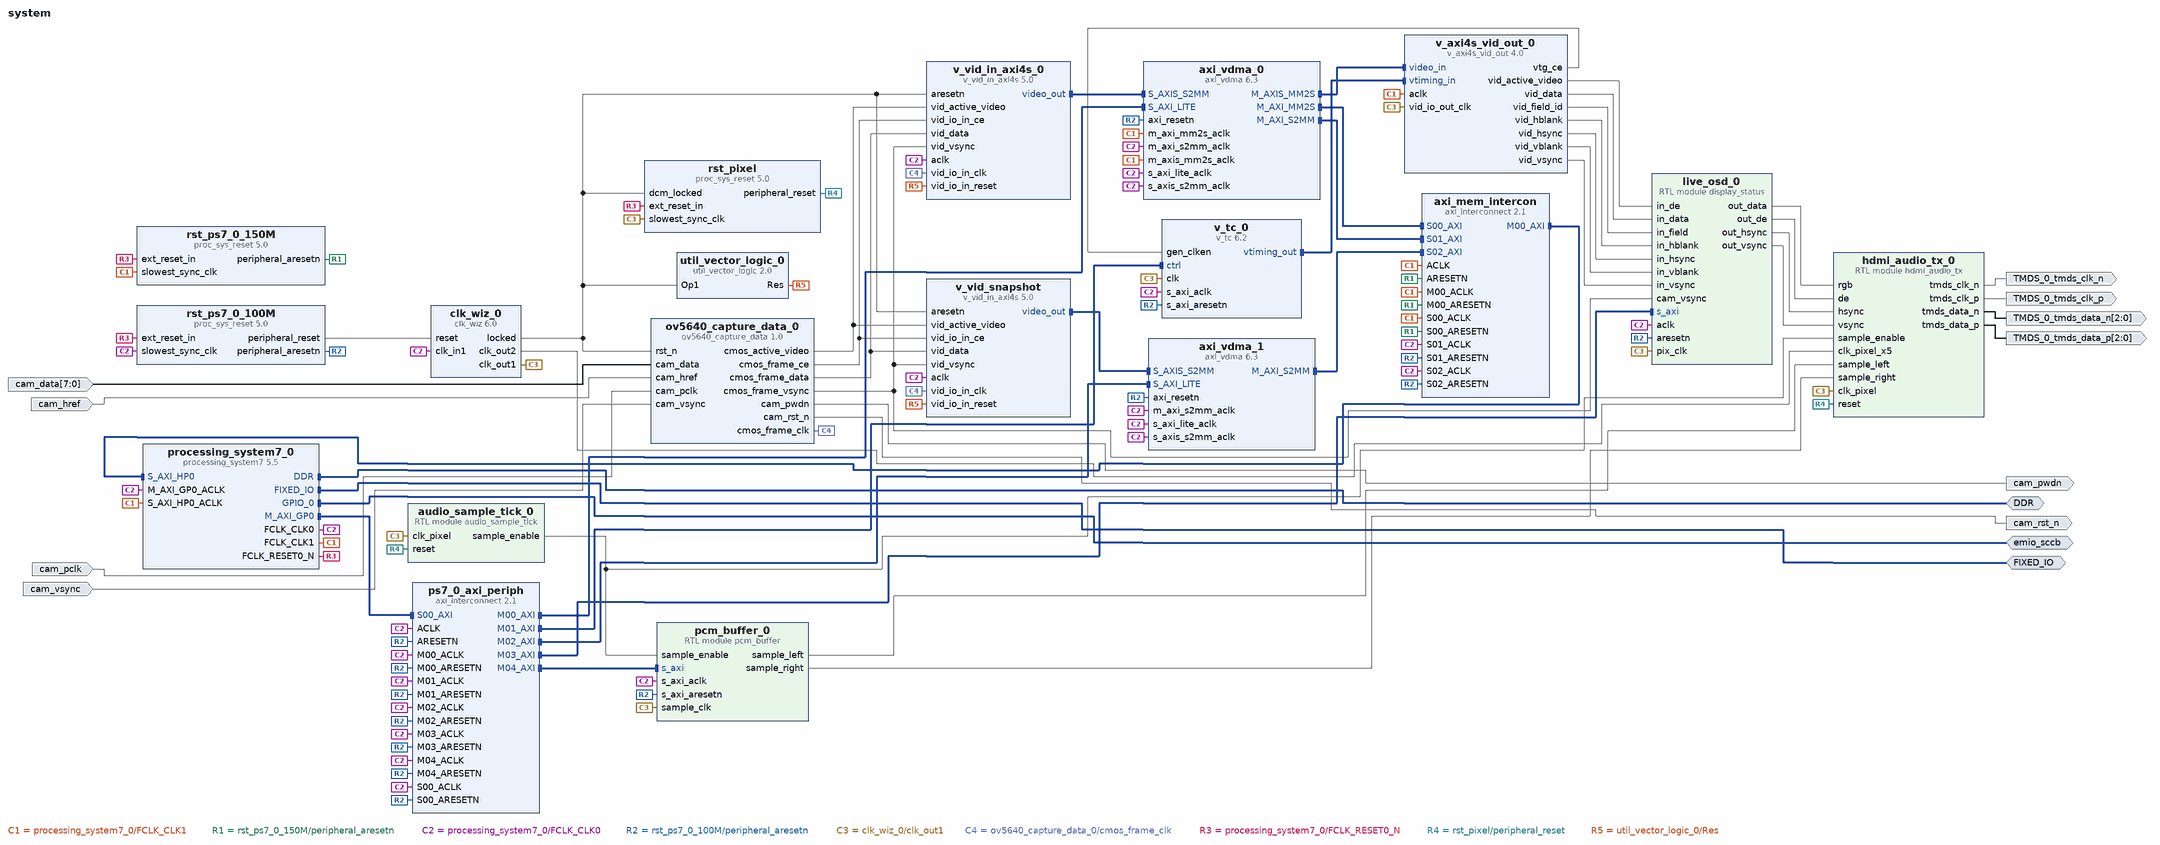
[diagram p0: block diagram of the top level]
# Vivado block design system, xc7z015clg485-2, Vivado 2025.2
create_bd_design system

create_bd_intf_port -mode Master -vlnv xilinx.com:interface:gpio_rtl:1.0 emio_sccb
create_bd_intf_port -mode Master -vlnv xilinx.com:interface:ddrx_rtl:1.0 DDR
create_bd_intf_port -mode Master -vlnv xilinx.com:display_processing_system7:fixedio_rtl:1.0 FIXED_IO
create_bd_port -dir O -from 2 -to 0 TMDS_0_tmds_data_p
create_bd_port -dir O TMDS_0_tmds_clk_p
create_bd_port -dir O -from 2 -to 0 TMDS_0_tmds_data_n
create_bd_port -dir O TMDS_0_tmds_clk_n
create_bd_port -dir I -type clk cam_pclk
set_property -dict {CONFIG.FREQ_HZ 100000000} [get_bd_ports cam_pclk]
create_bd_port -dir I cam_vsync
create_bd_port -dir I cam_href
create_bd_port -dir I -from 7 -to 0 cam_data
create_bd_port -dir O cam_rst_n
create_bd_port -dir O cam_pwdn

create_bd_cell -type ip -vlnv xilinx.com:ip:axi_interconnect:2.1 axi_mem_intercon
set_property -dict [list \
  CONFIG.ENABLE_ADVANCED_OPTIONS 0 \
  CONFIG.ENABLE_PROTOCOL_CHECKERS 0 \
  CONFIG.M00_HAS_DATA_FIFO 0 \
  CONFIG.M00_HAS_REGSLICE 0 \
  CONFIG.M00_ISSUANCE 0 \
  CONFIG.M00_SECURE 0 \
  CONFIG.M01_HAS_DATA_FIFO 0 \
  CONFIG.M01_HAS_REGSLICE 0 \
  CONFIG.M01_ISSUANCE 0 \
  CONFIG.M01_SECURE 0 \
  CONFIG.M02_HAS_DATA_FIFO 0 \
  CONFIG.M02_HAS_REGSLICE 0 \
  CONFIG.M02_ISSUANCE 0 \
  CONFIG.M02_SECURE 0 \
  CONFIG.M03_HAS_DATA_FIFO 0 \
  CONFIG.M03_HAS_REGSLICE 0 \
  CONFIG.M03_ISSUANCE 0 \
  CONFIG.M03_SECURE 0 \
  CONFIG.M04_HAS_DATA_FIFO 0 \
  CONFIG.M04_HAS_REGSLICE 0 \
  CONFIG.M04_ISSUANCE 0 \
  CONFIG.M04_SECURE 0 \
  CONFIG.M05_HAS_DATA_FIFO 0 \
  CONFIG.M05_HAS_REGSLICE 0 \
  CONFIG.M05_ISSUANCE 0 \
  CONFIG.M05_SECURE 0 \
  CONFIG.M06_HAS_DATA_FIFO 0 \
  CONFIG.M06_HAS_REGSLICE 0 \
  CONFIG.M06_ISSUANCE 0 \
  CONFIG.M06_SECURE 0 \
  CONFIG.M07_HAS_DATA_FIFO 0 \
  CONFIG.M07_HAS_REGSLICE 0 \
  CONFIG.M07_ISSUANCE 0 \
  CONFIG.M07_SECURE 0 \
  CONFIG.M08_HAS_DATA_FIFO 0 \
  CONFIG.M08_HAS_REGSLICE 0 \
  CONFIG.M08_ISSUANCE 0 \
  CONFIG.M08_SECURE 0 \
  CONFIG.M09_HAS_DATA_FIFO 0 \
  CONFIG.M09_HAS_REGSLICE 0 \
  CONFIG.M09_ISSUANCE 0 \
  CONFIG.M09_SECURE 0 \
  CONFIG.M10_HAS_DATA_FIFO 0 \
  CONFIG.M10_HAS_REGSLICE 0 \
  CONFIG.M10_ISSUANCE 0 \
  CONFIG.M10_SECURE 0 \
  CONFIG.M11_HAS_DATA_FIFO 0 \
  CONFIG.M11_HAS_REGSLICE 0 \
  CONFIG.M11_ISSUANCE 0 \
  CONFIG.M11_SECURE 0 \
  CONFIG.M12_HAS_DATA_FIFO 0 \
  CONFIG.M12_HAS_REGSLICE 0 \
  CONFIG.M12_ISSUANCE 0 \
  CONFIG.M12_SECURE 0 \
  CONFIG.M13_HAS_DATA_FIFO 0 \
  CONFIG.M13_HAS_REGSLICE 0 \
  CONFIG.M13_ISSUANCE 0 \
  CONFIG.M13_SECURE 0 \
  CONFIG.M14_HAS_DATA_FIFO 0 \
  CONFIG.M14_HAS_REGSLICE 0 \
  CONFIG.M14_ISSUANCE 0 \
  CONFIG.M14_SECURE 0 \
  CONFIG.M15_HAS_DATA_FIFO 0 \
  CONFIG.M15_HAS_REGSLICE 0 \
  CONFIG.M15_ISSUANCE 0 \
  CONFIG.M15_SECURE 0 \
  CONFIG.M16_HAS_DATA_FIFO 0 \
  CONFIG.M16_HAS_REGSLICE 0 \
  CONFIG.M16_ISSUANCE 0 \
  CONFIG.M16_SECURE 0 \
  CONFIG.M17_HAS_DATA_FIFO 0 \
  CONFIG.M17_HAS_REGSLICE 0 \
  CONFIG.M17_ISSUANCE 0 \
  CONFIG.M17_SECURE 0 \
  CONFIG.M18_HAS_DATA_FIFO 0 \
  CONFIG.M18_HAS_REGSLICE 0 \
  CONFIG.M18_ISSUANCE 0 \
  CONFIG.M18_SECURE 0 \
  CONFIG.M19_HAS_DATA_FIFO 0 \
  CONFIG.M19_HAS_REGSLICE 0 \
  CONFIG.M19_ISSUANCE 0 \
  CONFIG.M19_SECURE 0 \
  CONFIG.M20_HAS_DATA_FIFO 0 \
  CONFIG.M20_HAS_REGSLICE 0 \
  CONFIG.M20_ISSUANCE 0 \
  CONFIG.M20_SECURE 0 \
  CONFIG.M21_HAS_DATA_FIFO 0 \
  CONFIG.M21_HAS_REGSLICE 0 \
  CONFIG.M21_ISSUANCE 0 \
  CONFIG.M21_SECURE 0 \
  CONFIG.M22_HAS_DATA_FIFO 0 \
  CONFIG.M22_HAS_REGSLICE 0 \
  CONFIG.M22_ISSUANCE 0 \
  CONFIG.M22_SECURE 0 \
  CONFIG.M23_HAS_DATA_FIFO 0 \
  CONFIG.M23_HAS_REGSLICE 0 \
  CONFIG.M23_ISSUANCE 0 \
  CONFIG.M23_SECURE 0 \
  CONFIG.M24_HAS_DATA_FIFO 0 \
  CONFIG.M24_HAS_REGSLICE 0 \
  CONFIG.M24_ISSUANCE 0 \
  CONFIG.M24_SECURE 0 \
  CONFIG.M25_HAS_DATA_FIFO 0 \
  CONFIG.M25_HAS_REGSLICE 0 \
  CONFIG.M25_ISSUANCE 0 \
  CONFIG.M25_SECURE 0 \
  CONFIG.M26_HAS_DATA_FIFO 0 \
  CONFIG.M26_HAS_REGSLICE 0 \
  CONFIG.M26_ISSUANCE 0 \
  CONFIG.M26_SECURE 0 \
  CONFIG.M27_HAS_DATA_FIFO 0 \
  CONFIG.M27_HAS_REGSLICE 0 \
  CONFIG.M27_ISSUANCE 0 \
  CONFIG.M27_SECURE 0 \
  CONFIG.M28_HAS_DATA_FIFO 0 \
  CONFIG.M28_HAS_REGSLICE 0 \
  CONFIG.M28_ISSUANCE 0 \
  CONFIG.M28_SECURE 0 \
  CONFIG.M29_HAS_DATA_FIFO 0 \
  CONFIG.M29_HAS_REGSLICE 0 \
  CONFIG.M29_ISSUANCE 0 \
  CONFIG.M29_SECURE 0 \
  CONFIG.M30_HAS_DATA_FIFO 0 \
  CONFIG.M30_HAS_REGSLICE 0 \
  CONFIG.M30_ISSUANCE 0 \
  CONFIG.M30_SECURE 0 \
  CONFIG.M31_HAS_DATA_FIFO 0 \
  CONFIG.M31_HAS_REGSLICE 0 \
  CONFIG.M31_ISSUANCE 0 \
  CONFIG.M31_SECURE 0 \
  CONFIG.M32_HAS_DATA_FIFO 0 \
  CONFIG.M32_HAS_REGSLICE 0 \
  CONFIG.M32_ISSUANCE 0 \
  CONFIG.M32_SECURE 0 \
  CONFIG.M33_HAS_DATA_FIFO 0 \
  CONFIG.M33_HAS_REGSLICE 0 \
  CONFIG.M33_ISSUANCE 0 \
  CONFIG.M33_SECURE 0 \
  CONFIG.M34_HAS_DATA_FIFO 0 \
  CONFIG.M34_HAS_REGSLICE 0 \
  CONFIG.M34_ISSUANCE 0 \
  CONFIG.M34_SECURE 0 \
  CONFIG.M35_HAS_DATA_FIFO 0 \
  CONFIG.M35_HAS_REGSLICE 0 \
  CONFIG.M35_ISSUANCE 0 \
  CONFIG.M35_SECURE 0 \
  CONFIG.M36_HAS_DATA_FIFO 0 \
  CONFIG.M36_HAS_REGSLICE 0 \
  CONFIG.M36_ISSUANCE 0 \
  CONFIG.M36_SECURE 0 \
  CONFIG.M37_HAS_DATA_FIFO 0 \
  CONFIG.M37_HAS_REGSLICE 0 \
  CONFIG.M37_ISSUANCE 0 \
  CONFIG.M37_SECURE 0 \
  CONFIG.M38_HAS_DATA_FIFO 0 \
  CONFIG.M38_HAS_REGSLICE 0 \
  CONFIG.M38_ISSUANCE 0 \
  CONFIG.M38_SECURE 0 \
  CONFIG.M39_HAS_DATA_FIFO 0 \
  CONFIG.M39_HAS_REGSLICE 0 \
  CONFIG.M39_ISSUANCE 0 \
  CONFIG.M39_SECURE 0 \
  CONFIG.M40_HAS_DATA_FIFO 0 \
  CONFIG.M40_HAS_REGSLICE 0 \
  CONFIG.M40_ISSUANCE 0 \
  CONFIG.M40_SECURE 0 \
  CONFIG.M41_HAS_DATA_FIFO 0 \
  CONFIG.M41_HAS_REGSLICE 0 \
  CONFIG.M41_ISSUANCE 0 \
  CONFIG.M41_SECURE 0 \
  CONFIG.M42_HAS_DATA_FIFO 0 \
  CONFIG.M42_HAS_REGSLICE 0 \
  CONFIG.M42_ISSUANCE 0 \
  CONFIG.M42_SECURE 0 \
  CONFIG.M43_HAS_DATA_FIFO 0 \
  CONFIG.M43_HAS_REGSLICE 0 \
  CONFIG.M43_ISSUANCE 0 \
  CONFIG.M43_SECURE 0 \
  CONFIG.M44_HAS_DATA_FIFO 0 \
  CONFIG.M44_HAS_REGSLICE 0 \
  CONFIG.M44_ISSUANCE 0 \
  CONFIG.M44_SECURE 0 \
  CONFIG.M45_HAS_DATA_FIFO 0 \
  CONFIG.M45_HAS_REGSLICE 0 \
  CONFIG.M45_ISSUANCE 0 \
  CONFIG.M45_SECURE 0 \
  CONFIG.M46_HAS_DATA_FIFO 0 \
  CONFIG.M46_HAS_REGSLICE 0 \
  CONFIG.M46_ISSUANCE 0 \
  CONFIG.M46_SECURE 0 \
  CONFIG.M47_HAS_DATA_FIFO 0 \
  CONFIG.M47_HAS_REGSLICE 0 \
  CONFIG.M47_ISSUANCE 0 \
  CONFIG.M47_SECURE 0 \
  CONFIG.M48_HAS_DATA_FIFO 0 \
  CONFIG.M48_HAS_REGSLICE 0 \
  CONFIG.M48_ISSUANCE 0 \
  CONFIG.M48_SECURE 0 \
  CONFIG.M49_HAS_DATA_FIFO 0 \
  CONFIG.M49_HAS_REGSLICE 0 \
  CONFIG.M49_ISSUANCE 0 \
  CONFIG.M49_SECURE 0 \
  CONFIG.M50_HAS_DATA_FIFO 0 \
  CONFIG.M50_HAS_REGSLICE 0 \
  CONFIG.M50_ISSUANCE 0 \
  CONFIG.M50_SECURE 0 \
  CONFIG.M51_HAS_DATA_FIFO 0 \
  CONFIG.M51_HAS_REGSLICE 0 \
  CONFIG.M51_ISSUANCE 0 \
  CONFIG.M51_SECURE 0 \
  CONFIG.M52_HAS_DATA_FIFO 0 \
  CONFIG.M52_HAS_REGSLICE 0 \
  CONFIG.M52_ISSUANCE 0 \
  CONFIG.M52_SECURE 0 \
  CONFIG.M53_HAS_DATA_FIFO 0 \
  CONFIG.M53_HAS_REGSLICE 0 \
  CONFIG.M53_ISSUANCE 0 \
  CONFIG.M53_SECURE 0 \
  CONFIG.M54_HAS_DATA_FIFO 0 \
  CONFIG.M54_HAS_REGSLICE 0 \
  CONFIG.M54_ISSUANCE 0 \
  CONFIG.M54_SECURE 0 \
  CONFIG.M55_HAS_DATA_FIFO 0 \
  CONFIG.M55_HAS_REGSLICE 0 \
  CONFIG.M55_ISSUANCE 0 \
  CONFIG.M55_SECURE 0 \
  CONFIG.M56_HAS_DATA_FIFO 0 \
  CONFIG.M56_HAS_REGSLICE 0 \
  CONFIG.M56_ISSUANCE 0 \
  CONFIG.M56_SECURE 0 \
  CONFIG.M57_HAS_DATA_FIFO 0 \
  CONFIG.M57_HAS_REGSLICE 0 \
  CONFIG.M57_ISSUANCE 0 \
  CONFIG.M57_SECURE 0 \
  CONFIG.M58_HAS_DATA_FIFO 0 \
  CONFIG.M58_HAS_REGSLICE 0 \
  CONFIG.M58_ISSUANCE 0 \
  CONFIG.M58_SECURE 0 \
  CONFIG.M59_HAS_DATA_FIFO 0 \
  CONFIG.M59_HAS_REGSLICE 0 \
  CONFIG.M59_ISSUANCE 0 \
  CONFIG.M59_SECURE 0 \
  CONFIG.M60_HAS_DATA_FIFO 0 \
  CONFIG.M60_HAS_REGSLICE 0 \
  CONFIG.M60_ISSUANCE 0 \
  CONFIG.M60_SECURE 0 \
  CONFIG.M61_HAS_DATA_FIFO 0 \
  CONFIG.M61_HAS_REGSLICE 0 \
  CONFIG.M61_ISSUANCE 0 \
  CONFIG.M61_SECURE 0 \
  CONFIG.M62_HAS_DATA_FIFO 0 \
  CONFIG.M62_HAS_REGSLICE 0 \
  CONFIG.M62_ISSUANCE 0 \
  CONFIG.M62_SECURE 0 \
  CONFIG.M63_HAS_DATA_FIFO 0 \
  CONFIG.M63_HAS_REGSLICE 0 \
  CONFIG.M63_ISSUANCE 0 \
  CONFIG.M63_SECURE 0 \
  CONFIG.NUM_MI 1 \
  CONFIG.NUM_SI 3 \
  CONFIG.PCHK_MAX_RD_BURSTS 2 \
  CONFIG.PCHK_MAX_WR_BURSTS 2 \
  CONFIG.PCHK_WAITS 0 \
  CONFIG.S00_ARB_PRIORITY 0 \
  CONFIG.S00_HAS_DATA_FIFO 0 \
  CONFIG.S00_HAS_REGSLICE 0 \
  CONFIG.S01_ARB_PRIORITY 0 \
  CONFIG.S01_HAS_DATA_FIFO 0 \
  CONFIG.S01_HAS_REGSLICE 0 \
  CONFIG.S02_ARB_PRIORITY 0 \
  CONFIG.S02_HAS_DATA_FIFO 0 \
  CONFIG.S02_HAS_REGSLICE 0 \
  CONFIG.S03_ARB_PRIORITY 0 \
  CONFIG.S03_HAS_DATA_FIFO 0 \
  CONFIG.S03_HAS_REGSLICE 0 \
  CONFIG.S04_ARB_PRIORITY 0 \
  CONFIG.S04_HAS_DATA_FIFO 0 \
  CONFIG.S04_HAS_REGSLICE 0 \
  CONFIG.S05_ARB_PRIORITY 0 \
  CONFIG.S05_HAS_DATA_FIFO 0 \
  CONFIG.S05_HAS_REGSLICE 0 \
  CONFIG.S06_ARB_PRIORITY 0 \
  CONFIG.S06_HAS_DATA_FIFO 0 \
  CONFIG.S06_HAS_REGSLICE 0 \
  CONFIG.S07_ARB_PRIORITY 0 \
  CONFIG.S07_HAS_DATA_FIFO 0 \
  CONFIG.S07_HAS_REGSLICE 0 \
  CONFIG.S08_ARB_PRIORITY 0 \
  CONFIG.S08_HAS_DATA_FIFO 0 \
  CONFIG.S08_HAS_REGSLICE 0 \
  CONFIG.S09_ARB_PRIORITY 0 \
  CONFIG.S09_HAS_DATA_FIFO 0 \
  CONFIG.S09_HAS_REGSLICE 0 \
  CONFIG.S10_ARB_PRIORITY 0 \
  CONFIG.S10_HAS_DATA_FIFO 0 \
  CONFIG.S10_HAS_REGSLICE 0 \
  CONFIG.S11_ARB_PRIORITY 0 \
  CONFIG.S11_HAS_DATA_FIFO 0 \
  CONFIG.S11_HAS_REGSLICE 0 \
  CONFIG.S12_ARB_PRIORITY 0 \
  CONFIG.S12_HAS_DATA_FIFO 0 \
  CONFIG.S12_HAS_REGSLICE 0 \
  CONFIG.S13_ARB_PRIORITY 0 \
  CONFIG.S13_HAS_DATA_FIFO 0 \
  CONFIG.S13_HAS_REGSLICE 0 \
  CONFIG.S14_ARB_PRIORITY 0 \
  CONFIG.S14_HAS_DATA_FIFO 0 \
  CONFIG.S14_HAS_REGSLICE 0 \
  CONFIG.S15_ARB_PRIORITY 0 \
  CONFIG.S15_HAS_DATA_FIFO 0 \
  CONFIG.S15_HAS_REGSLICE 0 \
  CONFIG.STRATEGY 0 \
  CONFIG.SYNCHRONIZATION_STAGES 3 \
  CONFIG.XBAR_DATA_WIDTH 32 \
] [get_bd_cells axi_mem_intercon]
create_bd_cell -type ip -vlnv xilinx.com:ip:axi_vdma:6.3 axi_vdma_0
set_property -dict [list \
  CONFIG.C_FAMILY zynq \
  CONFIG.C_SELECT_XPM 0 \
  CONFIG.c_addr_width 32 \
  CONFIG.c_dlytmr_resolution 125 \
  CONFIG.c_dynamic_resolution 1 \
  CONFIG.c_enable_all 0 \
  CONFIG.c_enable_mm2s_buf_empty 0 \
  CONFIG.c_enable_mm2s_delay_counter 1 \
  CONFIG.c_enable_mm2s_frm_counter 1 \
  CONFIG.c_enable_mm2s_frmstr_reg 0 \
  CONFIG.c_enable_mm2s_fsync_out 0 \
  CONFIG.c_enable_mm2s_param_updt 0 \
  CONFIG.c_enable_mm2s_rst_out 0 \
  CONFIG.c_enable_s2mm_buf_full 0 \
  CONFIG.c_enable_s2mm_delay_counter 1 \
  CONFIG.c_enable_s2mm_frm_counter 1 \
  CONFIG.c_enable_s2mm_frmstr_reg 0 \
  CONFIG.c_enable_s2mm_fsync_out 0 \
  CONFIG.c_enable_s2mm_param_updt 0 \
  CONFIG.c_enable_s2mm_rst_out 0 \
  CONFIG.c_enable_s2mm_sts_reg 0 \
  CONFIG.c_enable_tstvec 0 \
  CONFIG.c_enable_vert_flip 0 \
  CONFIG.c_enable_vidprmtr_reads 1 \
  CONFIG.c_flush_on_fsync 1 \
  CONFIG.c_include_internal_genlock 1 \
  CONFIG.c_include_mm2s 1 \
  CONFIG.c_include_mm2s_dre 0 \
  CONFIG.c_include_mm2s_sf 0 \
  CONFIG.c_include_s2mm 1 \
  CONFIG.c_include_s2mm_dre 0 \
  CONFIG.c_include_s2mm_sf 1 \
  CONFIG.c_include_sg 0 \
  CONFIG.c_m_axi_mm2s_data_width 64 \
  CONFIG.c_m_axi_s2mm_data_width 64 \
  CONFIG.c_m_axis_mm2s_tdata_width 24 \
  CONFIG.c_mm2s_genlock_mode 3 \
  CONFIG.c_mm2s_genlock_num_masters 1 \
  CONFIG.c_mm2s_genlock_repeat_en 0 \
  CONFIG.c_mm2s_linebuffer_depth 2048 \
  CONFIG.c_mm2s_linebuffer_thresh 4 \
  CONFIG.c_mm2s_max_burst_length 64 \
  CONFIG.c_mm2s_sof_enable 1 \
  CONFIG.c_num_fstores 3 \
  CONFIG.c_s2mm_genlock_mode 2 \
  CONFIG.c_s2mm_genlock_num_masters 1 \
  CONFIG.c_s2mm_genlock_repeat_en 1 \
  CONFIG.c_s2mm_linebuffer_depth 2048 \
  CONFIG.c_s2mm_linebuffer_thresh 4 \
  CONFIG.c_s2mm_max_burst_length 64 \
  CONFIG.c_s2mm_sof_enable 1 \
  CONFIG.c_use_fsync 1 \
  CONFIG.c_use_mm2s_fsync 0 \
  CONFIG.c_use_s2mm_fsync 2 \
] [get_bd_cells axi_vdma_0]
create_bd_cell -type ip -vlnv xilinx.com:ip:axi_vdma:6.3 axi_vdma_1
set_property -dict [list \
  CONFIG.C_FAMILY zynq \
  CONFIG.C_SELECT_XPM 0 \
  CONFIG.c_addr_width 32 \
  CONFIG.c_dlytmr_resolution 125 \
  CONFIG.c_dynamic_resolution 1 \
  CONFIG.c_enable_all 0 \
  CONFIG.c_enable_mm2s_buf_empty 0 \
  CONFIG.c_enable_mm2s_delay_counter 1 \
  CONFIG.c_enable_mm2s_frm_counter 1 \
  CONFIG.c_enable_mm2s_frmstr_reg 0 \
  CONFIG.c_enable_mm2s_fsync_out 0 \
  CONFIG.c_enable_mm2s_param_updt 0 \
  CONFIG.c_enable_mm2s_rst_out 0 \
  CONFIG.c_enable_s2mm_buf_full 0 \
  CONFIG.c_enable_s2mm_delay_counter 1 \
  CONFIG.c_enable_s2mm_frm_counter 1 \
  CONFIG.c_enable_s2mm_frmstr_reg 0 \
  CONFIG.c_enable_s2mm_fsync_out 0 \
  CONFIG.c_enable_s2mm_param_updt 0 \
  CONFIG.c_enable_s2mm_rst_out 0 \
  CONFIG.c_enable_s2mm_sts_reg 0 \
  CONFIG.c_enable_tstvec 0 \
  CONFIG.c_enable_vert_flip 0 \
  CONFIG.c_enable_vidprmtr_reads 1 \
  CONFIG.c_flush_on_fsync 1 \
  CONFIG.c_include_internal_genlock 0 \
  CONFIG.c_include_mm2s 0 \
  CONFIG.c_include_mm2s_sf 0 \
  CONFIG.c_include_s2mm 1 \
  CONFIG.c_include_s2mm_dre 0 \
  CONFIG.c_include_s2mm_sf 1 \
  CONFIG.c_include_sg 0 \
  CONFIG.c_m_axi_s2mm_data_width 64 \
  CONFIG.c_mm2s_genlock_repeat_en 0 \
  CONFIG.c_mm2s_linebuffer_thresh 4 \
  CONFIG.c_mm2s_sof_enable 1 \
  CONFIG.c_num_fstores 2 \
  CONFIG.c_s2mm_genlock_mode 0 \
  CONFIG.c_s2mm_genlock_repeat_en 1 \
  CONFIG.c_s2mm_linebuffer_depth 2048 \
  CONFIG.c_s2mm_linebuffer_thresh 4 \
  CONFIG.c_s2mm_max_burst_length 64 \
  CONFIG.c_s2mm_sof_enable 1 \
  CONFIG.c_use_fsync 1 \
  CONFIG.c_use_s2mm_fsync 2 \
] [get_bd_cells axi_vdma_1]
create_bd_cell -type ip -vlnv xilinx.com:ip:clk_wiz:6.0 clk_wiz_0
set_property -dict [list \
  CONFIG.AUTO_PRIMITIVE MMCM \
  CONFIG.AXI_DRP false \
  CONFIG.CALC_DONE empty \
  CONFIG.CDDCDONE_PORT cddcdone \
  CONFIG.CDDCREQ_PORT cddcreq \
  CONFIG.CLKFB_IN_N_PORT clkfb_in_n \
  CONFIG.CLKFB_IN_PORT clkfb_in \
  CONFIG.CLKFB_IN_P_PORT clkfb_in_p \
  CONFIG.CLKFB_IN_SIGNALING SINGLE \
  CONFIG.CLKFB_OUT_N_PORT clkfb_out_n \
  CONFIG.CLKFB_OUT_PORT clkfb_out \
  CONFIG.CLKFB_OUT_P_PORT clkfb_out_p \
  CONFIG.CLKFB_STOPPED_PORT clkfb_stopped \
  CONFIG.CLKIN1_JITTER_PS 100.0 \
  CONFIG.CLKIN1_UI_JITTER 0.010 \
  CONFIG.CLKIN2_JITTER_PS 100.0 \
  CONFIG.CLKIN2_UI_JITTER 0.010 \
  CONFIG.CLKOUT1_DRIVES BUFG \
  CONFIG.CLKOUT1_JITTER 152.549 \
  CONFIG.CLKOUT1_MATCHED_ROUTING false \
  CONFIG.CLKOUT1_PHASE_ERROR 116.405 \
  CONFIG.CLKOUT1_REQUESTED_DUTY_CYCLE 50.000 \
  CONFIG.CLKOUT1_REQUESTED_OUT_FREQ 75.000 \
  CONFIG.CLKOUT1_REQUESTED_PHASE 0.000 \
  CONFIG.CLKOUT1_SEQUENCE_NUMBER 1 \
  CONFIG.CLKOUT1_USED true \
  CONFIG.CLKOUT2_DRIVES BUFG \
  CONFIG.CLKOUT2_JITTER 111.604 \
  CONFIG.CLKOUT2_MATCHED_ROUTING false \
  CONFIG.CLKOUT2_PHASE_ERROR 116.405 \
  CONFIG.CLKOUT2_REQUESTED_DUTY_CYCLE 50.000 \
  CONFIG.CLKOUT2_REQUESTED_OUT_FREQ 375.000 \
  CONFIG.CLKOUT2_REQUESTED_PHASE 0.000 \
  CONFIG.CLKOUT2_SEQUENCE_NUMBER 1 \
  CONFIG.CLKOUT2_USED true \
  CONFIG.CLKOUT3_DRIVES BUFG \
  CONFIG.CLKOUT3_JITTER 132.464 \
  CONFIG.CLKOUT3_MATCHED_ROUTING false \
  CONFIG.CLKOUT3_PHASE_ERROR 116.405 \
  CONFIG.CLKOUT3_REQUESTED_DUTY_CYCLE 50.000 \
  CONFIG.CLKOUT3_REQUESTED_OUT_FREQ 150.000 \
  CONFIG.CLKOUT3_REQUESTED_PHASE 0.000 \
  CONFIG.CLKOUT3_SEQUENCE_NUMBER 1 \
  CONFIG.CLKOUT3_USED true \
  CONFIG.CLKOUT4_DRIVES BUFG \
  CONFIG.CLKOUT4_JITTER 0.0 \
  CONFIG.CLKOUT4_MATCHED_ROUTING false \
  CONFIG.CLKOUT4_PHASE_ERROR 0.0 \
  CONFIG.CLKOUT4_REQUESTED_DUTY_CYCLE 50.000 \
  CONFIG.CLKOUT4_REQUESTED_OUT_FREQ 100.000 \
  CONFIG.CLKOUT4_REQUESTED_PHASE 0.000 \
  CONFIG.CLKOUT4_SEQUENCE_NUMBER 1 \
  CONFIG.CLKOUT4_USED false \
  CONFIG.CLKOUT5_DRIVES BUFG \
  CONFIG.CLKOUT5_JITTER 0.0 \
  CONFIG.CLKOUT5_MATCHED_ROUTING false \
  CONFIG.CLKOUT5_PHASE_ERROR 0.0 \
  CONFIG.CLKOUT5_REQUESTED_DUTY_CYCLE 50.000 \
  CONFIG.CLKOUT5_REQUESTED_OUT_FREQ 100.000 \
  CONFIG.CLKOUT5_REQUESTED_PHASE 0.000 \
  CONFIG.CLKOUT5_SEQUENCE_NUMBER 1 \
  CONFIG.CLKOUT5_USED false \
  CONFIG.CLKOUT6_DRIVES BUFG \
  CONFIG.CLKOUT6_JITTER 0.0 \
  CONFIG.CLKOUT6_MATCHED_ROUTING false \
  CONFIG.CLKOUT6_PHASE_ERROR 0.0 \
  CONFIG.CLKOUT6_REQUESTED_DUTY_CYCLE 50.000 \
  CONFIG.CLKOUT6_REQUESTED_OUT_FREQ 100.000 \
  CONFIG.CLKOUT6_REQUESTED_PHASE 0.000 \
  CONFIG.CLKOUT6_SEQUENCE_NUMBER 1 \
  CONFIG.CLKOUT6_USED false \
  CONFIG.CLKOUT7_DRIVES BUFG \
  CONFIG.CLKOUT7_JITTER 0.0 \
  CONFIG.CLKOUT7_MATCHED_ROUTING false \
  CONFIG.CLKOUT7_PHASE_ERROR 0.0 \
  CONFIG.CLKOUT7_REQUESTED_DUTY_CYCLE 50.000 \
  CONFIG.CLKOUT7_REQUESTED_OUT_FREQ 100.000 \
  CONFIG.CLKOUT7_REQUESTED_PHASE 0.000 \
  CONFIG.CLKOUT7_SEQUENCE_NUMBER 1 \
  CONFIG.CLKOUT7_USED false \
  CONFIG.CLKOUTPHY_REQUESTED_FREQ 600.000 \
  CONFIG.CLK_IN1_BOARD_INTERFACE Custom \
  CONFIG.CLK_IN2_BOARD_INTERFACE Custom \
  CONFIG.CLK_IN_SEL_PORT clk_in_sel \
  CONFIG.CLK_OUT1_PORT clk_out1 \
  CONFIG.CLK_OUT1_USE_FINE_PS_GUI false \
  CONFIG.CLK_OUT2_PORT clk_out2 \
  CONFIG.CLK_OUT2_USE_FINE_PS_GUI false \
  CONFIG.CLK_OUT3_PORT clk_out3 \
  CONFIG.CLK_OUT3_USE_FINE_PS_GUI false \
  CONFIG.CLK_OUT4_PORT clk_out4 \
  CONFIG.CLK_OUT4_USE_FINE_PS_GUI false \
  CONFIG.CLK_OUT5_PORT clk_out5 \
  CONFIG.CLK_OUT5_USE_FINE_PS_GUI false \
  CONFIG.CLK_OUT6_PORT clk_out6 \
  CONFIG.CLK_OUT6_USE_FINE_PS_GUI false \
  CONFIG.CLK_OUT7_PORT clk_out7 \
  CONFIG.CLK_OUT7_USE_FINE_PS_GUI false \
  CONFIG.CLK_VALID_PORT CLK_VALID \
  CONFIG.CLOCK_MGR_TYPE auto \
  CONFIG.DADDR_PORT daddr \
  CONFIG.DCLK_PORT dclk \
  CONFIG.DEN_PORT den \
  CONFIG.DIFF_CLK_IN1_BOARD_INTERFACE Custom \
  CONFIG.DIFF_CLK_IN2_BOARD_INTERFACE Custom \
  CONFIG.DIN_PORT din \
  CONFIG.DOUT_PORT dout \
  CONFIG.DRDY_PORT drdy \
  CONFIG.DWE_PORT dwe \
  CONFIG.ENABLE_CDDC false \
  CONFIG.ENABLE_CLKOUTPHY false \
  CONFIG.ENABLE_CLOCK_MONITOR false \
  CONFIG.ENABLE_USER_CLOCK0 false \
  CONFIG.ENABLE_USER_CLOCK1 false \
  CONFIG.ENABLE_USER_CLOCK2 false \
  CONFIG.ENABLE_USER_CLOCK3 false \
  CONFIG.Enable_PLL0 false \
  CONFIG.Enable_PLL1 false \
  CONFIG.FEEDBACK_SOURCE FDBK_AUTO \
  CONFIG.INPUT_CLK_STOPPED_PORT input_clk_stopped \
  CONFIG.INPUT_MODE frequency \
  CONFIG.INTERFACE_SELECTION Enable_AXI \
  CONFIG.IN_FREQ_UNITS Units_MHz \
  CONFIG.IN_JITTER_UNITS Units_UI \
  CONFIG.JITTER_OPTIONS UI \
  CONFIG.JITTER_SEL No_Jitter \
  CONFIG.LOCKED_PORT locked \
  CONFIG.MMCM_BANDWIDTH OPTIMIZED \
  CONFIG.MMCM_CLKFBOUT_MULT_F 7.500 \
  CONFIG.MMCM_CLKFBOUT_PHASE 0.000 \
  CONFIG.MMCM_CLKFBOUT_USE_FINE_PS false \
  CONFIG.MMCM_CLKIN1_PERIOD 10.000 \
  CONFIG.MMCM_CLKIN2_PERIOD 10.000 \
  CONFIG.MMCM_CLKOUT0_DIVIDE_F 10.000 \
  CONFIG.MMCM_CLKOUT0_DUTY_CYCLE 0.500 \
  CONFIG.MMCM_CLKOUT0_PHASE 0.000 \
  CONFIG.MMCM_CLKOUT0_USE_FINE_PS false \
  CONFIG.MMCM_CLKOUT1_DIVIDE 2 \
  CONFIG.MMCM_CLKOUT1_DUTY_CYCLE 0.500 \
  CONFIG.MMCM_CLKOUT1_PHASE 0.000 \
  CONFIG.MMCM_CLKOUT1_USE_FINE_PS false \
  CONFIG.MMCM_CLKOUT2_DIVIDE 5 \
  CONFIG.MMCM_CLKOUT2_DUTY_CYCLE 0.500 \
  CONFIG.MMCM_CLKOUT2_PHASE 0.000 \
  CONFIG.MMCM_CLKOUT2_USE_FINE_PS false \
  CONFIG.MMCM_CLKOUT3_DIVIDE 1 \
  CONFIG.MMCM_CLKOUT3_DUTY_CYCLE 0.500 \
  CONFIG.MMCM_CLKOUT3_PHASE 0.000 \
  CONFIG.MMCM_CLKOUT3_USE_FINE_PS false \
  CONFIG.MMCM_CLKOUT4_CASCADE false \
  CONFIG.MMCM_CLKOUT4_DIVIDE 1 \
  CONFIG.MMCM_CLKOUT4_DUTY_CYCLE 0.500 \
  CONFIG.MMCM_CLKOUT4_PHASE 0.000 \
  CONFIG.MMCM_CLKOUT4_USE_FINE_PS false \
  CONFIG.MMCM_CLKOUT5_DIVIDE 1 \
  CONFIG.MMCM_CLKOUT5_DUTY_CYCLE 0.500 \
  CONFIG.MMCM_CLKOUT5_PHASE 0.000 \
  CONFIG.MMCM_CLKOUT5_USE_FINE_PS false \
  CONFIG.MMCM_CLKOUT6_DIVIDE 1 \
  CONFIG.MMCM_CLKOUT6_DUTY_CYCLE 0.500 \
  CONFIG.MMCM_CLKOUT6_PHASE 0.000 \
  CONFIG.MMCM_CLKOUT6_USE_FINE_PS false \
  CONFIG.MMCM_CLOCK_HOLD false \
  CONFIG.MMCM_COMPENSATION ZHOLD \
  CONFIG.MMCM_DIVCLK_DIVIDE 1 \
  CONFIG.MMCM_NOTES None \
  CONFIG.MMCM_REF_JITTER1 0.010 \
  CONFIG.MMCM_REF_JITTER2 0.010 \
  CONFIG.MMCM_STARTUP_WAIT false \
  CONFIG.NUM_OUT_CLKS 3 \
  CONFIG.OPTIMIZE_CLOCKING_STRUCTURE_EN false \
  CONFIG.OVERRIDE_MMCM false \
  CONFIG.OVERRIDE_PLL false \
  CONFIG.PHASESHIFT_MODE WAVEFORM \
  CONFIG.PHASE_DUTY_CONFIG false \
  CONFIG.PLATFORM UNKNOWN \
  CONFIG.PLL_BANDWIDTH OPTIMIZED \
  CONFIG.PLL_CLKFBOUT_MULT 4 \
  CONFIG.PLL_CLKFBOUT_PHASE 0.000 \
  CONFIG.PLL_CLKIN_PERIOD 10.000 \
  CONFIG.PLL_CLKOUT0_DIVIDE 1 \
  CONFIG.PLL_CLKOUT0_DUTY_CYCLE 0.500 \
  CONFIG.PLL_CLKOUT0_PHASE 0.000 \
  CONFIG.PLL_CLKOUT1_DIVIDE 1 \
  CONFIG.PLL_CLKOUT1_DUTY_CYCLE 0.500 \
  CONFIG.PLL_CLKOUT1_PHASE 0.000 \
  CONFIG.PLL_CLKOUT2_DIVIDE 1 \
  CONFIG.PLL_CLKOUT2_DUTY_CYCLE 0.500 \
  CONFIG.PLL_CLKOUT2_PHASE 0.000 \
  CONFIG.PLL_CLKOUT3_DIVIDE 1 \
  CONFIG.PLL_CLKOUT3_DUTY_CYCLE 0.500 \
  CONFIG.PLL_CLKOUT3_PHASE 0.000 \
  CONFIG.PLL_CLKOUT4_DIVIDE 1 \
  CONFIG.PLL_CLKOUT4_DUTY_CYCLE 0.500 \
  CONFIG.PLL_CLKOUT4_PHASE 0.000 \
  CONFIG.PLL_CLKOUT5_DIVIDE 1 \
  CONFIG.PLL_CLKOUT5_DUTY_CYCLE 0.500 \
  CONFIG.PLL_CLKOUT5_PHASE 0.000 \
  CONFIG.PLL_CLK_FEEDBACK CLKFBOUT \
  CONFIG.PLL_COMPENSATION SYSTEM_SYNCHRONOUS \
  CONFIG.PLL_DIVCLK_DIVIDE 1 \
  CONFIG.PLL_NOTES None \
  CONFIG.PLL_REF_JITTER 0.010 \
  CONFIG.POWER_DOWN_PORT power_down \
  CONFIG.PRECISION 1 \
  CONFIG.PRIMARY_PORT clk_in1 \
  CONFIG.PRIMITIVE MMCM \
  CONFIG.PRIMTYPE_SEL mmcm_adv \
  CONFIG.PRIM_IN_FREQ 100.000 \
  CONFIG.PRIM_IN_JITTER 0.010 \
  CONFIG.PRIM_IN_TIMEPERIOD 10.000 \
  CONFIG.PRIM_SOURCE No_buffer \
  CONFIG.PSCLK_PORT psclk \
  CONFIG.PSDONE_PORT psdone \
  CONFIG.PSEN_PORT psen \
  CONFIG.PSINCDEC_PORT psincdec \
  CONFIG.REF_CLK_FREQ 100.0 \
  CONFIG.RELATIVE_INCLK REL_PRIMARY \
  CONFIG.RESET_BOARD_INTERFACE Custom \
  CONFIG.RESET_PORT reset \
  CONFIG.RESET_TYPE ACTIVE_HIGH \
  CONFIG.SECONDARY_IN_FREQ 100.000 \
  CONFIG.SECONDARY_IN_JITTER 0.010 \
  CONFIG.SECONDARY_IN_TIMEPERIOD 10.000 \
  CONFIG.SECONDARY_PORT clk_in2 \
  CONFIG.SECONDARY_SOURCE Single_ended_clock_capable_pin \
  CONFIG.SS_MODE CENTER_HIGH \
  CONFIG.SS_MOD_FREQ 250 \
  CONFIG.SS_MOD_TIME 0.004 \
  CONFIG.STATUS_PORT STATUS \
  CONFIG.SUMMARY_STRINGS empty \
  CONFIG.USER_CLK_FREQ0 100.0 \
  CONFIG.USER_CLK_FREQ1 100.0 \
  CONFIG.USER_CLK_FREQ2 100.0 \
  CONFIG.USER_CLK_FREQ3 100.0 \
  CONFIG.USE_BOARD_FLOW false \
  CONFIG.USE_CLKFB_STOPPED false \
  CONFIG.USE_CLK_VALID false \
  CONFIG.USE_CLOCK_SEQUENCING false \
  CONFIG.USE_DYN_PHASE_SHIFT false \
  CONFIG.USE_DYN_RECONFIG false \
  CONFIG.USE_FREEZE false \
  CONFIG.USE_FREQ_SYNTH true \
  CONFIG.USE_INCLK_STOPPED false \
  CONFIG.USE_INCLK_SWITCHOVER false \
  CONFIG.USE_LOCKED true \
  CONFIG.USE_MAX_I_JITTER false \
  CONFIG.USE_MIN_O_JITTER false \
  CONFIG.USE_MIN_POWER false \
  CONFIG.USE_PHASE_ALIGNMENT true \
  CONFIG.USE_POWER_DOWN false \
  CONFIG.USE_RESET true \
  CONFIG.USE_SAFE_CLOCK_STARTUP false \
  CONFIG.USE_SPREAD_SPECTRUM false \
  CONFIG.USE_STATUS false \
] [get_bd_cells clk_wiz_0]
create_bd_cell -type module -reference display_status live_osd_0
set_property -dict {CONFIG.HEIGHT 720 CONFIG.PIXEL_HZ 75000000 CONFIG.WIDTH 1280} [get_bd_cells live_osd_0]
create_bd_cell -type ip -vlnv alientek.com:user:ov5640_capture_data:1.0 ov5640_capture_data_0
create_bd_cell -type ip -vlnv xilinx.com:ip:processing_system7:5.5 processing_system7_0
set_property -dict [list \
  CONFIG.PCW_APU_PERIPHERAL_FREQMHZ 666.666666 \
  CONFIG.PCW_CPU_CPU_6X4X_MAX_RANGE 767 \
  CONFIG.PCW_ENET0_ENET0_IO {MIO 16 .. 27} \
  CONFIG.PCW_ENET0_GRP_MDIO_ENABLE 1 \
  CONFIG.PCW_ENET0_GRP_MDIO_IO {MIO 52 .. 53} \
  CONFIG.PCW_ENET0_PERIPHERAL_ENABLE 1 \
  CONFIG.PCW_EN_CLK1_PORT 1 \
  CONFIG.PCW_FCLK_CLK0_BUF FALSE \
  CONFIG.PCW_FCLK_CLK1_BUF TRUE \
  CONFIG.PCW_FPGA0_PERIPHERAL_FREQMHZ 100 \
  CONFIG.PCW_FPGA1_PERIPHERAL_FREQMHZ 150 \
  CONFIG.PCW_FPGA_FCLK1_ENABLE 1 \
  CONFIG.PCW_GPIO_EMIO_GPIO_ENABLE 1 \
  CONFIG.PCW_GPIO_EMIO_GPIO_IO 2 \
  CONFIG.PCW_GPIO_EMIO_GPIO_WIDTH 2 \
  CONFIG.PCW_GPIO_MIO_GPIO_ENABLE 0 \
  CONFIG.PCW_PERIPHERAL_BOARD_PRESET None \
  CONFIG.PCW_PRESET_BANK1_VOLTAGE {LVCMOS 1.8V} \
  CONFIG.PCW_QSPI_PERIPHERAL_ENABLE 0 \
  CONFIG.PCW_SD0_GRP_CD_ENABLE 1 \
  CONFIG.PCW_SD0_GRP_CD_IO {MIO 10} \
  CONFIG.PCW_SD0_GRP_WP_ENABLE 0 \
  CONFIG.PCW_SD0_PERIPHERAL_ENABLE 1 \
  CONFIG.PCW_SD0_SD0_IO {MIO 40 .. 45} \
  CONFIG.PCW_SDIO_PERIPHERAL_FREQMHZ 100 \
  CONFIG.PCW_UART0_PERIPHERAL_ENABLE 1 \
  CONFIG.PCW_UART0_UART0_IO {MIO 14 .. 15} \
  CONFIG.PCW_UART1_PERIPHERAL_ENABLE 0 \
  CONFIG.PCW_UART_PERIPHERAL_FREQMHZ 100 \
  CONFIG.PCW_UIPARAM_DDR_FREQ_MHZ 533.333333 \
  CONFIG.PCW_UIPARAM_DDR_MEMORY_TYPE {DDR 3 (Low Voltage)} \
  CONFIG.PCW_UIPARAM_DDR_PARTNO {MT41K256M16 RE-125} \
  CONFIG.PCW_USB0_PERIPHERAL_ENABLE 0 \
  CONFIG.PCW_USE_S_AXI_HP0 1 \
  CONFIG.preset None \
] [get_bd_cells processing_system7_0]
# 403 more settings of processing_system7_0 are not shown: defaults, MIO pin electricals, DDR timing, and values the tool derives
create_bd_cell -type ip -vlnv xilinx.com:ip:axi_interconnect:2.1 ps7_0_axi_periph
set_property -dict [list \
  CONFIG.ENABLE_ADVANCED_OPTIONS 0 \
  CONFIG.ENABLE_PROTOCOL_CHECKERS 0 \
  CONFIG.M00_HAS_DATA_FIFO 0 \
  CONFIG.M00_HAS_REGSLICE 0 \
  CONFIG.M00_ISSUANCE 0 \
  CONFIG.M00_SECURE 0 \
  CONFIG.M01_HAS_DATA_FIFO 0 \
  CONFIG.M01_HAS_REGSLICE 0 \
  CONFIG.M01_ISSUANCE 0 \
  CONFIG.M01_SECURE 0 \
  CONFIG.M02_HAS_DATA_FIFO 0 \
  CONFIG.M02_HAS_REGSLICE 0 \
  CONFIG.M02_ISSUANCE 0 \
  CONFIG.M02_SECURE 0 \
  CONFIG.M03_HAS_DATA_FIFO 0 \
  CONFIG.M03_HAS_REGSLICE 0 \
  CONFIG.M03_ISSUANCE 0 \
  CONFIG.M03_SECURE 0 \
  CONFIG.M04_HAS_DATA_FIFO 0 \
  CONFIG.M04_HAS_REGSLICE 0 \
  CONFIG.M04_ISSUANCE 0 \
  CONFIG.M04_SECURE 0 \
  CONFIG.M05_HAS_DATA_FIFO 0 \
  CONFIG.M05_HAS_REGSLICE 0 \
  CONFIG.M05_ISSUANCE 0 \
  CONFIG.M05_SECURE 0 \
  CONFIG.M06_HAS_DATA_FIFO 0 \
  CONFIG.M06_HAS_REGSLICE 0 \
  CONFIG.M06_ISSUANCE 0 \
  CONFIG.M06_SECURE 0 \
  CONFIG.M07_HAS_DATA_FIFO 0 \
  CONFIG.M07_HAS_REGSLICE 0 \
  CONFIG.M07_ISSUANCE 0 \
  CONFIG.M07_SECURE 0 \
  CONFIG.M08_HAS_DATA_FIFO 0 \
  CONFIG.M08_HAS_REGSLICE 0 \
  CONFIG.M08_ISSUANCE 0 \
  CONFIG.M08_SECURE 0 \
  CONFIG.M09_HAS_DATA_FIFO 0 \
  CONFIG.M09_HAS_REGSLICE 0 \
  CONFIG.M09_ISSUANCE 0 \
  CONFIG.M09_SECURE 0 \
  CONFIG.M10_HAS_DATA_FIFO 0 \
  CONFIG.M10_HAS_REGSLICE 0 \
  CONFIG.M10_ISSUANCE 0 \
  CONFIG.M10_SECURE 0 \
  CONFIG.M11_HAS_DATA_FIFO 0 \
  CONFIG.M11_HAS_REGSLICE 0 \
  CONFIG.M11_ISSUANCE 0 \
  CONFIG.M11_SECURE 0 \
  CONFIG.M12_HAS_DATA_FIFO 0 \
  CONFIG.M12_HAS_REGSLICE 0 \
  CONFIG.M12_ISSUANCE 0 \
  CONFIG.M12_SECURE 0 \
  CONFIG.M13_HAS_DATA_FIFO 0 \
  CONFIG.M13_HAS_REGSLICE 0 \
  CONFIG.M13_ISSUANCE 0 \
  CONFIG.M13_SECURE 0 \
  CONFIG.M14_HAS_DATA_FIFO 0 \
  CONFIG.M14_HAS_REGSLICE 0 \
  CONFIG.M14_ISSUANCE 0 \
  CONFIG.M14_SECURE 0 \
  CONFIG.M15_HAS_DATA_FIFO 0 \
  CONFIG.M15_HAS_REGSLICE 0 \
  CONFIG.M15_ISSUANCE 0 \
  CONFIG.M15_SECURE 0 \
  CONFIG.M16_HAS_DATA_FIFO 0 \
  CONFIG.M16_HAS_REGSLICE 0 \
  CONFIG.M16_ISSUANCE 0 \
  CONFIG.M16_SECURE 0 \
  CONFIG.M17_HAS_DATA_FIFO 0 \
  CONFIG.M17_HAS_REGSLICE 0 \
  CONFIG.M17_ISSUANCE 0 \
  CONFIG.M17_SECURE 0 \
  CONFIG.M18_HAS_DATA_FIFO 0 \
  CONFIG.M18_HAS_REGSLICE 0 \
  CONFIG.M18_ISSUANCE 0 \
  CONFIG.M18_SECURE 0 \
  CONFIG.M19_HAS_DATA_FIFO 0 \
  CONFIG.M19_HAS_REGSLICE 0 \
  CONFIG.M19_ISSUANCE 0 \
  CONFIG.M19_SECURE 0 \
  CONFIG.M20_HAS_DATA_FIFO 0 \
  CONFIG.M20_HAS_REGSLICE 0 \
  CONFIG.M20_ISSUANCE 0 \
  CONFIG.M20_SECURE 0 \
  CONFIG.M21_HAS_DATA_FIFO 0 \
  CONFIG.M21_HAS_REGSLICE 0 \
  CONFIG.M21_ISSUANCE 0 \
  CONFIG.M21_SECURE 0 \
  CONFIG.M22_HAS_DATA_FIFO 0 \
  CONFIG.M22_HAS_REGSLICE 0 \
  CONFIG.M22_ISSUANCE 0 \
  CONFIG.M22_SECURE 0 \
  CONFIG.M23_HAS_DATA_FIFO 0 \
  CONFIG.M23_HAS_REGSLICE 0 \
  CONFIG.M23_ISSUANCE 0 \
  CONFIG.M23_SECURE 0 \
  CONFIG.M24_HAS_DATA_FIFO 0 \
  CONFIG.M24_HAS_REGSLICE 0 \
  CONFIG.M24_ISSUANCE 0 \
  CONFIG.M24_SECURE 0 \
  CONFIG.M25_HAS_DATA_FIFO 0 \
  CONFIG.M25_HAS_REGSLICE 0 \
  CONFIG.M25_ISSUANCE 0 \
  CONFIG.M25_SECURE 0 \
  CONFIG.M26_HAS_DATA_FIFO 0 \
  CONFIG.M26_HAS_REGSLICE 0 \
  CONFIG.M26_ISSUANCE 0 \
  CONFIG.M26_SECURE 0 \
  CONFIG.M27_HAS_DATA_FIFO 0 \
  CONFIG.M27_HAS_REGSLICE 0 \
  CONFIG.M27_ISSUANCE 0 \
  CONFIG.M27_SECURE 0 \
  CONFIG.M28_HAS_DATA_FIFO 0 \
  CONFIG.M28_HAS_REGSLICE 0 \
  CONFIG.M28_ISSUANCE 0 \
  CONFIG.M28_SECURE 0 \
  CONFIG.M29_HAS_DATA_FIFO 0 \
  CONFIG.M29_HAS_REGSLICE 0 \
  CONFIG.M29_ISSUANCE 0 \
  CONFIG.M29_SECURE 0 \
  CONFIG.M30_HAS_DATA_FIFO 0 \
  CONFIG.M30_HAS_REGSLICE 0 \
  CONFIG.M30_ISSUANCE 0 \
  CONFIG.M30_SECURE 0 \
  CONFIG.M31_HAS_DATA_FIFO 0 \
  CONFIG.M31_HAS_REGSLICE 0 \
  CONFIG.M31_ISSUANCE 0 \
  CONFIG.M31_SECURE 0 \
  CONFIG.M32_HAS_DATA_FIFO 0 \
  CONFIG.M32_HAS_REGSLICE 0 \
  CONFIG.M32_ISSUANCE 0 \
  CONFIG.M32_SECURE 0 \
  CONFIG.M33_HAS_DATA_FIFO 0 \
  CONFIG.M33_HAS_REGSLICE 0 \
  CONFIG.M33_ISSUANCE 0 \
  CONFIG.M33_SECURE 0 \
  CONFIG.M34_HAS_DATA_FIFO 0 \
  CONFIG.M34_HAS_REGSLICE 0 \
  CONFIG.M34_ISSUANCE 0 \
  CONFIG.M34_SECURE 0 \
  CONFIG.M35_HAS_DATA_FIFO 0 \
  CONFIG.M35_HAS_REGSLICE 0 \
  CONFIG.M35_ISSUANCE 0 \
  CONFIG.M35_SECURE 0 \
  CONFIG.M36_HAS_DATA_FIFO 0 \
  CONFIG.M36_HAS_REGSLICE 0 \
  CONFIG.M36_ISSUANCE 0 \
  CONFIG.M36_SECURE 0 \
  CONFIG.M37_HAS_DATA_FIFO 0 \
  CONFIG.M37_HAS_REGSLICE 0 \
  CONFIG.M37_ISSUANCE 0 \
  CONFIG.M37_SECURE 0 \
  CONFIG.M38_HAS_DATA_FIFO 0 \
  CONFIG.M38_HAS_REGSLICE 0 \
  CONFIG.M38_ISSUANCE 0 \
  CONFIG.M38_SECURE 0 \
  CONFIG.M39_HAS_DATA_FIFO 0 \
  CONFIG.M39_HAS_REGSLICE 0 \
  CONFIG.M39_ISSUANCE 0 \
  CONFIG.M39_SECURE 0 \
  CONFIG.M40_HAS_DATA_FIFO 0 \
  CONFIG.M40_HAS_REGSLICE 0 \
  CONFIG.M40_ISSUANCE 0 \
  CONFIG.M40_SECURE 0 \
  CONFIG.M41_HAS_DATA_FIFO 0 \
  CONFIG.M41_HAS_REGSLICE 0 \
  CONFIG.M41_ISSUANCE 0 \
  CONFIG.M41_SECURE 0 \
  CONFIG.M42_HAS_DATA_FIFO 0 \
  CONFIG.M42_HAS_REGSLICE 0 \
  CONFIG.M42_ISSUANCE 0 \
  CONFIG.M42_SECURE 0 \
  CONFIG.M43_HAS_DATA_FIFO 0 \
  CONFIG.M43_HAS_REGSLICE 0 \
  CONFIG.M43_ISSUANCE 0 \
  CONFIG.M43_SECURE 0 \
  CONFIG.M44_HAS_DATA_FIFO 0 \
  CONFIG.M44_HAS_REGSLICE 0 \
  CONFIG.M44_ISSUANCE 0 \
  CONFIG.M44_SECURE 0 \
  CONFIG.M45_HAS_DATA_FIFO 0 \
  CONFIG.M45_HAS_REGSLICE 0 \
  CONFIG.M45_ISSUANCE 0 \
  CONFIG.M45_SECURE 0 \
  CONFIG.M46_HAS_DATA_FIFO 0 \
  CONFIG.M46_HAS_REGSLICE 0 \
  CONFIG.M46_ISSUANCE 0 \
  CONFIG.M46_SECURE 0 \
  CONFIG.M47_HAS_DATA_FIFO 0 \
  CONFIG.M47_HAS_REGSLICE 0 \
  CONFIG.M47_ISSUANCE 0 \
  CONFIG.M47_SECURE 0 \
  CONFIG.M48_HAS_DATA_FIFO 0 \
  CONFIG.M48_HAS_REGSLICE 0 \
  CONFIG.M48_ISSUANCE 0 \
  CONFIG.M48_SECURE 0 \
  CONFIG.M49_HAS_DATA_FIFO 0 \
  CONFIG.M49_HAS_REGSLICE 0 \
  CONFIG.M49_ISSUANCE 0 \
  CONFIG.M49_SECURE 0 \
  CONFIG.M50_HAS_DATA_FIFO 0 \
  CONFIG.M50_HAS_REGSLICE 0 \
  CONFIG.M50_ISSUANCE 0 \
  CONFIG.M50_SECURE 0 \
  CONFIG.M51_HAS_DATA_FIFO 0 \
  CONFIG.M51_HAS_REGSLICE 0 \
  CONFIG.M51_ISSUANCE 0 \
  CONFIG.M51_SECURE 0 \
  CONFIG.M52_HAS_DATA_FIFO 0 \
  CONFIG.M52_HAS_REGSLICE 0 \
  CONFIG.M52_ISSUANCE 0 \
  CONFIG.M52_SECURE 0 \
  CONFIG.M53_HAS_DATA_FIFO 0 \
  CONFIG.M53_HAS_REGSLICE 0 \
  CONFIG.M53_ISSUANCE 0 \
  CONFIG.M53_SECURE 0 \
  CONFIG.M54_HAS_DATA_FIFO 0 \
  CONFIG.M54_HAS_REGSLICE 0 \
  CONFIG.M54_ISSUANCE 0 \
  CONFIG.M54_SECURE 0 \
  CONFIG.M55_HAS_DATA_FIFO 0 \
  CONFIG.M55_HAS_REGSLICE 0 \
  CONFIG.M55_ISSUANCE 0 \
  CONFIG.M55_SECURE 0 \
  CONFIG.M56_HAS_DATA_FIFO 0 \
  CONFIG.M56_HAS_REGSLICE 0 \
  CONFIG.M56_ISSUANCE 0 \
  CONFIG.M56_SECURE 0 \
  CONFIG.M57_HAS_DATA_FIFO 0 \
  CONFIG.M57_HAS_REGSLICE 0 \
  CONFIG.M57_ISSUANCE 0 \
  CONFIG.M57_SECURE 0 \
  CONFIG.M58_HAS_DATA_FIFO 0 \
  CONFIG.M58_HAS_REGSLICE 0 \
  CONFIG.M58_ISSUANCE 0 \
  CONFIG.M58_SECURE 0 \
  CONFIG.M59_HAS_DATA_FIFO 0 \
  CONFIG.M59_HAS_REGSLICE 0 \
  CONFIG.M59_ISSUANCE 0 \
  CONFIG.M59_SECURE 0 \
  CONFIG.M60_HAS_DATA_FIFO 0 \
  CONFIG.M60_HAS_REGSLICE 0 \
  CONFIG.M60_ISSUANCE 0 \
  CONFIG.M60_SECURE 0 \
  CONFIG.M61_HAS_DATA_FIFO 0 \
  CONFIG.M61_HAS_REGSLICE 0 \
  CONFIG.M61_ISSUANCE 0 \
  CONFIG.M61_SECURE 0 \
  CONFIG.M62_HAS_DATA_FIFO 0 \
  CONFIG.M62_HAS_REGSLICE 0 \
  CONFIG.M62_ISSUANCE 0 \
  CONFIG.M62_SECURE 0 \
  CONFIG.M63_HAS_DATA_FIFO 0 \
  CONFIG.M63_HAS_REGSLICE 0 \
  CONFIG.M63_ISSUANCE 0 \
  CONFIG.M63_SECURE 0 \
  CONFIG.NUM_MI 5 \
  CONFIG.NUM_SI 1 \
  CONFIG.PCHK_MAX_RD_BURSTS 2 \
  CONFIG.PCHK_MAX_WR_BURSTS 2 \
  CONFIG.PCHK_WAITS 0 \
  CONFIG.S00_ARB_PRIORITY 0 \
  CONFIG.S00_HAS_DATA_FIFO 0 \
  CONFIG.S00_HAS_REGSLICE 0 \
  CONFIG.S01_ARB_PRIORITY 0 \
  CONFIG.S01_HAS_DATA_FIFO 0 \
  CONFIG.S01_HAS_REGSLICE 0 \
  CONFIG.S02_ARB_PRIORITY 0 \
  CONFIG.S02_HAS_DATA_FIFO 0 \
  CONFIG.S02_HAS_REGSLICE 0 \
  CONFIG.S03_ARB_PRIORITY 0 \
  CONFIG.S03_HAS_DATA_FIFO 0 \
  CONFIG.S03_HAS_REGSLICE 0 \
  CONFIG.S04_ARB_PRIORITY 0 \
  CONFIG.S04_HAS_DATA_FIFO 0 \
  CONFIG.S04_HAS_REGSLICE 0 \
  CONFIG.S05_ARB_PRIORITY 0 \
  CONFIG.S05_HAS_DATA_FIFO 0 \
  CONFIG.S05_HAS_REGSLICE 0 \
  CONFIG.S06_ARB_PRIORITY 0 \
  CONFIG.S06_HAS_DATA_FIFO 0 \
  CONFIG.S06_HAS_REGSLICE 0 \
  CONFIG.S07_ARB_PRIORITY 0 \
  CONFIG.S07_HAS_DATA_FIFO 0 \
  CONFIG.S07_HAS_REGSLICE 0 \
  CONFIG.S08_ARB_PRIORITY 0 \
  CONFIG.S08_HAS_DATA_FIFO 0 \
  CONFIG.S08_HAS_REGSLICE 0 \
  CONFIG.S09_ARB_PRIORITY 0 \
  CONFIG.S09_HAS_DATA_FIFO 0 \
  CONFIG.S09_HAS_REGSLICE 0 \
  CONFIG.S10_ARB_PRIORITY 0 \
  CONFIG.S10_HAS_DATA_FIFO 0 \
  CONFIG.S10_HAS_REGSLICE 0 \
  CONFIG.S11_ARB_PRIORITY 0 \
  CONFIG.S11_HAS_DATA_FIFO 0 \
  CONFIG.S11_HAS_REGSLICE 0 \
  CONFIG.S12_ARB_PRIORITY 0 \
  CONFIG.S12_HAS_DATA_FIFO 0 \
  CONFIG.S12_HAS_REGSLICE 0 \
  CONFIG.S13_ARB_PRIORITY 0 \
  CONFIG.S13_HAS_DATA_FIFO 0 \
  CONFIG.S13_HAS_REGSLICE 0 \
  CONFIG.S14_ARB_PRIORITY 0 \
  CONFIG.S14_HAS_DATA_FIFO 0 \
  CONFIG.S14_HAS_REGSLICE 0 \
  CONFIG.S15_ARB_PRIORITY 0 \
  CONFIG.S15_HAS_DATA_FIFO 0 \
  CONFIG.S15_HAS_REGSLICE 0 \
  CONFIG.STRATEGY 0 \
  CONFIG.SYNCHRONIZATION_STAGES 3 \
  CONFIG.XBAR_DATA_WIDTH 32 \
] [get_bd_cells ps7_0_axi_periph]
create_bd_cell -type ip -vlnv xilinx.com:ip:proc_sys_reset:5.0 rst_ps7_0_100M
set_property -dict [list \
  CONFIG.C_AUX_RESET_HIGH 0 \
  CONFIG.C_AUX_RST_WIDTH 4 \
  CONFIG.C_EXT_RST_WIDTH 4 \
  CONFIG.C_NUM_BUS_RST 1 \
  CONFIG.C_NUM_INTERCONNECT_ARESETN 1 \
  CONFIG.C_NUM_PERP_ARESETN 1 \
  CONFIG.C_NUM_PERP_RST 1 \
  CONFIG.RESET_BOARD_INTERFACE Custom \
  CONFIG.USE_BOARD_FLOW false \
] [get_bd_cells rst_ps7_0_100M]
create_bd_cell -type ip -vlnv xilinx.com:ip:proc_sys_reset:5.0 rst_ps7_0_150M
set_property -dict [list \
  CONFIG.C_AUX_RESET_HIGH 0 \
  CONFIG.C_AUX_RST_WIDTH 4 \
  CONFIG.C_EXT_RST_WIDTH 4 \
  CONFIG.C_NUM_BUS_RST 1 \
  CONFIG.C_NUM_INTERCONNECT_ARESETN 1 \
  CONFIG.C_NUM_PERP_ARESETN 1 \
  CONFIG.C_NUM_PERP_RST 1 \
  CONFIG.RESET_BOARD_INTERFACE Custom \
  CONFIG.USE_BOARD_FLOW false \
] [get_bd_cells rst_ps7_0_150M]
create_bd_cell -type ip -vlnv xilinx.com:ip:util_vector_logic:2.0 util_vector_logic_0
set_property -dict {CONFIG.C_OPERATION not CONFIG.C_SIZE 1} [get_bd_cells util_vector_logic_0]
create_bd_cell -type ip -vlnv xilinx.com:ip:v_axi4s_vid_out:4.0 v_axi4s_vid_out_0
set_property -dict [list \
  CONFIG.ARBITRARY_RES_EN false \
  CONFIG.C_ADDR_WIDTH 10 \
  CONFIG.C_ADDR_WIDTH_PIXEL_REMAP_420 10 \
  CONFIG.C_HAS_ASYNC_CLK 1 \
  CONFIG.C_HYSTERESIS_LEVEL 12 \
  CONFIG.C_INCLUDE_PIXEL_REMAP_420 0 \
  CONFIG.C_INCLUDE_PIXEL_REPEAT 0 \
  CONFIG.C_NATIVE_COMPONENT_WIDTH 8 \
  CONFIG.C_PIXELS_PER_CLOCK 1 \
  CONFIG.C_SYNC_LOCK_THRESHOLD 4 \
  CONFIG.C_S_AXIS_VIDEO_DATA_WIDTH 8 \
  CONFIG.C_S_AXIS_VIDEO_FORMAT 2 \
  CONFIG.C_VTG_MASTER_SLAVE 0 \
] [get_bd_cells v_axi4s_vid_out_0]
create_bd_cell -type ip -vlnv xilinx.com:ip:v_tc:6.2 v_tc_0
set_property -dict [list \
  CONFIG.ARBITRARY_RES_EN false \
  CONFIG.C_FAMILY virtex7 \
  CONFIG.FSYNC_HSTART0 0 \
  CONFIG.FSYNC_VSTART0 0 \
  CONFIG.GEN_AVIDEO_POLARITY High \
  CONFIG.GEN_CPARITY 0 \
  CONFIG.GEN_HBLANK_POLARITY High \
  CONFIG.GEN_HSYNC_POLARITY High \
  CONFIG.GEN_VBLANK_POLARITY High \
  CONFIG.GEN_VIDEO_FORMAT RGB \
  CONFIG.GEN_VSYNC_POLARITY High \
  CONFIG.HAS_AXI4_LITE true \
  CONFIG.HAS_INTC_IF false \
  CONFIG.INTERLACE_EN false \
  CONFIG.SYNC_EN false \
  CONFIG.VIDEO_MODE 720p \
  CONFIG.active_chroma_generation false \
  CONFIG.active_video_generation true \
  CONFIG.enable_detection false \
  CONFIG.enable_generation true \
  CONFIG.frame_syncs 1 \
  CONFIG.horizontal_blank_generation true \
  CONFIG.horizontal_sync_generation true \
  CONFIG.max_clocks_per_line 4096 \
  CONFIG.max_lines_per_frame 4096 \
  CONFIG.vertical_blank_generation true \
  CONFIG.vertical_sync_generation true \
] [get_bd_cells v_tc_0]
create_bd_cell -type ip -vlnv xilinx.com:ip:v_vid_in_axi4s:5.0 v_vid_in_axi4s_0
set_property -dict [list \
  CONFIG.C_ADDR_WIDTH 10 \
  CONFIG.C_ADDR_WIDTH_PIXEL_REMAP_420 10 \
  CONFIG.C_HAS_ASYNC_CLK 1 \
  CONFIG.C_INCLUDE_PIXEL_DROP 0 \
  CONFIG.C_INCLUDE_PIXEL_REMAP_420 0 \
  CONFIG.C_M_AXIS_VIDEO_DATA_WIDTH 8 \
  CONFIG.C_M_AXIS_VIDEO_FORMAT 2 \
  CONFIG.C_NATIVE_COMPONENT_WIDTH 8 \
  CONFIG.C_PIXELS_PER_CLOCK 1 \
  CONFIG.C_VID_NATIVE_DE 0 \
] [get_bd_cells v_vid_in_axi4s_0]
create_bd_cell -type ip -vlnv xilinx.com:ip:v_vid_in_axi4s:5.0 v_vid_snapshot
set_property -dict [list \
  CONFIG.C_ADDR_WIDTH 10 \
  CONFIG.C_ADDR_WIDTH_PIXEL_REMAP_420 10 \
  CONFIG.C_HAS_ASYNC_CLK 1 \
  CONFIG.C_INCLUDE_PIXEL_DROP 0 \
  CONFIG.C_INCLUDE_PIXEL_REMAP_420 0 \
  CONFIG.C_M_AXIS_VIDEO_DATA_WIDTH 8 \
  CONFIG.C_M_AXIS_VIDEO_FORMAT 2 \
  CONFIG.C_NATIVE_COMPONENT_WIDTH 8 \
  CONFIG.C_PIXELS_PER_CLOCK 1 \
  CONFIG.C_VID_NATIVE_DE 0 \
] [get_bd_cells v_vid_snapshot]
create_bd_cell -type module -reference hdmi_audio_tx hdmi_audio_tx_0
create_bd_cell -type module -reference audio_sample_tick audio_sample_tick_0
create_bd_cell -type module -reference pcm_buffer pcm_buffer_0
set_property -dict {CONFIG.USE_SAMPLE_ENABLE 1} [get_bd_cells pcm_buffer_0]
create_bd_cell -type ip -vlnv xilinx.com:ip:proc_sys_reset:5.0 rst_pixel

# ---- connections ----

connect_bd_intf_net [get_bd_intf_pins axi_mem_intercon/S00_AXI] [get_bd_intf_pins axi_vdma_0/M_AXI_MM2S]
connect_bd_intf_net [get_bd_intf_pins axi_mem_intercon/S01_AXI] [get_bd_intf_pins axi_vdma_0/M_AXI_S2MM]
connect_bd_intf_net [get_bd_intf_pins axi_mem_intercon/S02_AXI] [get_bd_intf_pins axi_vdma_1/M_AXI_S2MM]
connect_bd_intf_net [get_bd_intf_pins axi_mem_intercon/M00_AXI] [get_bd_intf_pins processing_system7_0/S_AXI_HP0]
connect_bd_intf_net [get_bd_intf_pins axi_vdma_0/M_AXIS_MM2S] [get_bd_intf_pins v_axi4s_vid_out_0/video_in]
connect_bd_intf_net [get_bd_intf_ports DDR] [get_bd_intf_pins processing_system7_0/DDR]
connect_bd_intf_net [get_bd_intf_ports FIXED_IO] [get_bd_intf_pins processing_system7_0/FIXED_IO]
connect_bd_intf_net [get_bd_intf_ports emio_sccb] [get_bd_intf_pins processing_system7_0/GPIO_0]
connect_bd_intf_net [get_bd_intf_pins processing_system7_0/M_AXI_GP0] [get_bd_intf_pins ps7_0_axi_periph/S00_AXI]
connect_bd_intf_net [get_bd_intf_pins axi_vdma_0/S_AXI_LITE] [get_bd_intf_pins ps7_0_axi_periph/M00_AXI]
connect_bd_intf_net [get_bd_intf_pins ps7_0_axi_periph/M01_AXI] [get_bd_intf_pins v_tc_0/ctrl]
connect_bd_intf_net [get_bd_intf_pins axi_vdma_1/S_AXI_LITE] [get_bd_intf_pins ps7_0_axi_periph/M02_AXI]
connect_bd_intf_net [get_bd_intf_pins live_osd_0/s_axi] [get_bd_intf_pins ps7_0_axi_periph/M03_AXI]
connect_bd_intf_net [get_bd_intf_pins ps7_0_axi_periph/M04_AXI] [get_bd_intf_pins pcm_buffer_0/s_axi]
connect_bd_intf_net [get_bd_intf_pins v_axi4s_vid_out_0/vtiming_in] [get_bd_intf_pins v_tc_0/vtiming_out]
connect_bd_intf_net [get_bd_intf_pins axi_vdma_0/S_AXIS_S2MM] [get_bd_intf_pins v_vid_in_axi4s_0/video_out]
connect_bd_intf_net [get_bd_intf_pins axi_vdma_1/S_AXIS_S2MM] [get_bd_intf_pins v_vid_snapshot/video_out]
connect_bd_net -net ACLK_1 [get_bd_pins processing_system7_0/FCLK_CLK1] \
  [get_bd_pins axi_mem_intercon/ACLK] [get_bd_pins axi_mem_intercon/S00_ACLK] [get_bd_pins axi_mem_intercon/M00_ACLK] \
  [get_bd_pins axi_vdma_0/m_axi_mm2s_aclk] [get_bd_pins axi_vdma_0/m_axis_mm2s_aclk] \
  [get_bd_pins processing_system7_0/S_AXI_HP0_ACLK] [get_bd_pins rst_ps7_0_150M/slowest_sync_clk] \
  [get_bd_pins v_axi4s_vid_out_0/aclk]
connect_bd_net -net ARESETN_1 [get_bd_pins rst_ps7_0_150M/peripheral_aresetn] \
  [get_bd_pins axi_mem_intercon/ARESETN] [get_bd_pins axi_mem_intercon/S00_ARESETN] \
  [get_bd_pins axi_mem_intercon/M00_ARESETN]
connect_bd_net -net S01_ACLK_1 [get_bd_pins processing_system7_0/FCLK_CLK0] \
  [get_bd_pins axi_mem_intercon/S01_ACLK] [get_bd_pins axi_mem_intercon/S02_ACLK] [get_bd_pins axi_vdma_0/s_axi_lite_aclk] \
  [get_bd_pins axi_vdma_0/m_axi_s2mm_aclk] [get_bd_pins axi_vdma_0/s_axis_s2mm_aclk] [get_bd_pins axi_vdma_1/s_axi_lite_aclk] \
  [get_bd_pins axi_vdma_1/m_axi_s2mm_aclk] [get_bd_pins axi_vdma_1/s_axis_s2mm_aclk] [get_bd_pins clk_wiz_0/clk_in1] \
  [get_bd_pins live_osd_0/aclk] [get_bd_pins processing_system7_0/M_AXI_GP0_ACLK] [get_bd_pins ps7_0_axi_periph/ACLK] \
  [get_bd_pins ps7_0_axi_periph/S00_ACLK] [get_bd_pins ps7_0_axi_periph/M00_ACLK] [get_bd_pins ps7_0_axi_periph/M01_ACLK] \
  [get_bd_pins ps7_0_axi_periph/M02_ACLK] [get_bd_pins ps7_0_axi_periph/M03_ACLK] \
  [get_bd_pins rst_ps7_0_100M/slowest_sync_clk] [get_bd_pins v_tc_0/s_axi_aclk] [get_bd_pins v_vid_in_axi4s_0/aclk] \
  [get_bd_pins v_vid_snapshot/aclk] [get_bd_pins ps7_0_axi_periph/M04_ACLK] [get_bd_pins pcm_buffer_0/s_axi_aclk]
connect_bd_net -net S01_ARESETN_1 [get_bd_pins rst_ps7_0_100M/peripheral_aresetn] \
  [get_bd_pins axi_mem_intercon/S01_ARESETN] [get_bd_pins axi_mem_intercon/S02_ARESETN] [get_bd_pins axi_vdma_0/axi_resetn] \
  [get_bd_pins axi_vdma_1/axi_resetn] [get_bd_pins live_osd_0/aresetn] [get_bd_pins ps7_0_axi_periph/ARESETN] \
  [get_bd_pins ps7_0_axi_periph/S00_ARESETN] [get_bd_pins ps7_0_axi_periph/M00_ARESETN] \
  [get_bd_pins ps7_0_axi_periph/M01_ARESETN] [get_bd_pins ps7_0_axi_periph/M02_ARESETN] \
  [get_bd_pins ps7_0_axi_periph/M03_ARESETN] [get_bd_pins v_tc_0/s_axi_aresetn] [get_bd_pins ps7_0_axi_periph/M04_ARESETN] \
  [get_bd_pins pcm_buffer_0/s_axi_aresetn]
connect_bd_net [get_bd_pins audio_sample_tick_0/sample_enable] [get_bd_pins pcm_buffer_0/sample_enable] [get_bd_pins hdmi_audio_tx_0/sample_enable]
connect_bd_net [get_bd_ports cam_data] [get_bd_pins ov5640_capture_data_0/cam_data]
connect_bd_net [get_bd_ports cam_href] [get_bd_pins ov5640_capture_data_0/cam_href]
connect_bd_net [get_bd_ports cam_pclk] [get_bd_pins ov5640_capture_data_0/cam_pclk]
connect_bd_net [get_bd_ports cam_vsync] [get_bd_pins ov5640_capture_data_0/cam_vsync]
connect_bd_net [get_bd_pins clk_wiz_0/clk_out1] \
  [get_bd_pins hdmi_audio_tx_0/clk_pixel] [get_bd_pins live_osd_0/pix_clk] [get_bd_pins v_axi4s_vid_out_0/vid_io_out_clk] \
  [get_bd_pins v_tc_0/clk] [get_bd_pins rst_pixel/slowest_sync_clk] [get_bd_pins audio_sample_tick_0/clk_pixel] \
  [get_bd_pins pcm_buffer_0/sample_clk]
connect_bd_net [get_bd_pins clk_wiz_0/clk_out2] [get_bd_pins hdmi_audio_tx_0/clk_pixel_x5]
connect_bd_net [get_bd_pins clk_wiz_0/locked] \
  [get_bd_pins ov5640_capture_data_0/rst_n] [get_bd_pins util_vector_logic_0/Op1] [get_bd_pins v_vid_in_axi4s_0/aresetn] \
  [get_bd_pins v_vid_snapshot/aresetn] [get_bd_pins rst_pixel/dcm_locked]
connect_bd_net [get_bd_pins hdmi_audio_tx_0/tmds_clk_n] [get_bd_ports TMDS_0_tmds_clk_n]
connect_bd_net [get_bd_pins hdmi_audio_tx_0/tmds_clk_p] [get_bd_ports TMDS_0_tmds_clk_p]
connect_bd_net [get_bd_pins hdmi_audio_tx_0/tmds_data_n] [get_bd_ports TMDS_0_tmds_data_n]
connect_bd_net [get_bd_pins hdmi_audio_tx_0/tmds_data_p] [get_bd_ports TMDS_0_tmds_data_p]
connect_bd_net [get_bd_pins live_osd_0/out_data] [get_bd_pins hdmi_audio_tx_0/rgb]
connect_bd_net [get_bd_pins live_osd_0/out_de] [get_bd_pins hdmi_audio_tx_0/de]
connect_bd_net [get_bd_pins live_osd_0/out_hsync] [get_bd_pins hdmi_audio_tx_0/hsync]
connect_bd_net [get_bd_pins live_osd_0/out_vsync] [get_bd_pins hdmi_audio_tx_0/vsync]
connect_bd_net [get_bd_pins ov5640_capture_data_0/cam_pwdn] [get_bd_ports cam_pwdn]
connect_bd_net [get_bd_pins ov5640_capture_data_0/cam_rst_n] [get_bd_ports cam_rst_n]
connect_bd_net [get_bd_pins ov5640_capture_data_0/cmos_active_video] \
  [get_bd_pins v_vid_in_axi4s_0/vid_active_video] [get_bd_pins v_vid_snapshot/vid_active_video]
connect_bd_net [get_bd_pins ov5640_capture_data_0/cmos_frame_ce] [get_bd_pins v_vid_in_axi4s_0/vid_io_in_ce] [get_bd_pins v_vid_snapshot/vid_io_in_ce]
connect_bd_net [get_bd_pins ov5640_capture_data_0/cmos_frame_clk] \
  [get_bd_pins v_vid_in_axi4s_0/vid_io_in_clk] [get_bd_pins v_vid_snapshot/vid_io_in_clk]
connect_bd_net [get_bd_pins ov5640_capture_data_0/cmos_frame_data] [get_bd_pins v_vid_in_axi4s_0/vid_data] [get_bd_pins v_vid_snapshot/vid_data]
connect_bd_net [get_bd_pins ov5640_capture_data_0/cmos_frame_vsync] \
  [get_bd_pins live_osd_0/cam_vsync] [get_bd_pins v_vid_in_axi4s_0/vid_vsync] [get_bd_pins v_vid_snapshot/vid_vsync]
connect_bd_net [get_bd_pins pcm_buffer_0/sample_left] [get_bd_pins hdmi_audio_tx_0/sample_left]
connect_bd_net [get_bd_pins pcm_buffer_0/sample_right] [get_bd_pins hdmi_audio_tx_0/sample_right]
connect_bd_net [get_bd_pins processing_system7_0/FCLK_RESET0_N] \
  [get_bd_pins rst_ps7_0_100M/ext_reset_in] [get_bd_pins rst_ps7_0_150M/ext_reset_in] [get_bd_pins rst_pixel/ext_reset_in]
connect_bd_net [get_bd_pins rst_pixel/peripheral_reset] [get_bd_pins hdmi_audio_tx_0/reset] [get_bd_pins audio_sample_tick_0/reset]
connect_bd_net [get_bd_pins rst_ps7_0_100M/peripheral_reset] [get_bd_pins clk_wiz_0/reset]
connect_bd_net [get_bd_pins util_vector_logic_0/Res] [get_bd_pins v_vid_in_axi4s_0/vid_io_in_reset] [get_bd_pins v_vid_snapshot/vid_io_in_reset]
connect_bd_net [get_bd_pins v_axi4s_vid_out_0/vid_active_video] [get_bd_pins live_osd_0/in_de]
connect_bd_net [get_bd_pins v_axi4s_vid_out_0/vid_data] [get_bd_pins live_osd_0/in_data]
connect_bd_net [get_bd_pins v_axi4s_vid_out_0/vid_field_id] [get_bd_pins live_osd_0/in_field]
connect_bd_net [get_bd_pins v_axi4s_vid_out_0/vid_hblank] [get_bd_pins live_osd_0/in_hblank]
connect_bd_net [get_bd_pins v_axi4s_vid_out_0/vid_hsync] [get_bd_pins live_osd_0/in_hsync]
connect_bd_net [get_bd_pins v_axi4s_vid_out_0/vid_vblank] [get_bd_pins live_osd_0/in_vblank]
connect_bd_net [get_bd_pins v_axi4s_vid_out_0/vid_vsync] [get_bd_pins live_osd_0/in_vsync]
connect_bd_net [get_bd_pins v_axi4s_vid_out_0/vtg_ce] [get_bd_pins v_tc_0/gen_clken]

# ---- address map ----
assign_bd_address -offset 0x00000000 -range 1G -target_address_space [get_bd_addr_spaces axi_vdma_0/Data_MM2S] [get_bd_addr_segs processing_system7_0/S_AXI_HP0/HP0_DDR_LOWOCM]
assign_bd_address -offset 0x00000000 -range 1G -target_address_space [get_bd_addr_spaces axi_vdma_0/Data_S2MM] [get_bd_addr_segs processing_system7_0/S_AXI_HP0/HP0_DDR_LOWOCM]
assign_bd_address -offset 0x00000000 -range 1G -target_address_space [get_bd_addr_spaces axi_vdma_1/Data_S2MM] [get_bd_addr_segs processing_system7_0/S_AXI_HP0/HP0_DDR_LOWOCM]
assign_bd_address -offset 0x43000000 -range 64K -target_address_space [get_bd_addr_spaces processing_system7_0/Data] [get_bd_addr_segs axi_vdma_0/S_AXI_LITE/Reg]
assign_bd_address -offset 0x43010000 -range 64K -target_address_space [get_bd_addr_spaces processing_system7_0/Data] [get_bd_addr_segs axi_vdma_1/S_AXI_LITE/Reg]
assign_bd_address -offset 0x43C00000 -range 64K -target_address_space [get_bd_addr_spaces processing_system7_0/Data] [get_bd_addr_segs live_osd_0/s_axi/reg0]
assign_bd_address -offset 0x43C10000 -range 64K -target_address_space [get_bd_addr_spaces processing_system7_0/Data] [get_bd_addr_segs v_tc_0/ctrl/Reg]
assign_bd_address -offset 0x43C20000 -range 64K -target_address_space [get_bd_addr_spaces processing_system7_0/Data] [get_bd_addr_segs pcm_buffer_0/s_axi/reg0]

validate_bd_design
save_bd_design
